# Altium schematic sheet Display.SchDoc
size A; SheetNumber: 4; SheetTotal: 6
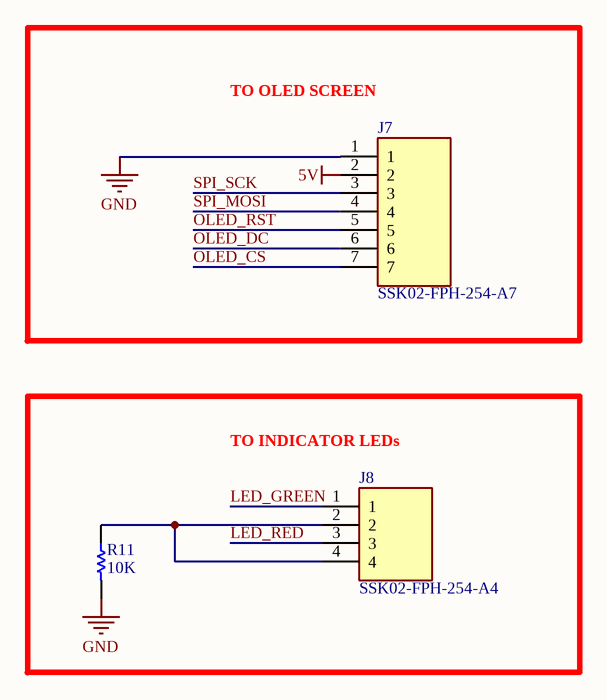
[diagram p0: Display.SchDoc]

## Parts
J7  SSK02-FPH-254-A7  [SAMESKY_SSK02-FPH-254-A7]
J8  SSK02-FPH-254-A4  [SAMESKY_SSK02-FPH-254-A4]
R11  10K  [RESA60-630X240]

## Blocks framed on the sheet
TO OLED SCREEN: J7
TO INDICATOR LEDs: J8 R11

## Nets
5V: J7.2
GND: J7.1 R11.2
LED_GREEN: J8.1
LED_RED: J8.3
OLED_CS: J7.7
OLED_DC: J7.6
OLED_RST: J7.5
SPI_MOSI: J7.4
SPI_SCK: J7.3
NetJ8_2: J8.2 J8.4 R11.1

## Library data of the parts
J7 = SSK02-FPH-254-A7: MF: {'manufacturer': u'Same Sky (Formerly CUI Devices)'}; Package: None; Price: None; Value: *; MP: SSK02-FPH-254-A7; Availability: Unavailable
J8 = SSK02-FPH-254-A4: 4 Position Header Connector 0.100 (2.54mm) Through Hole Gold; MF: Same Sky (Formerly CUI Devices); SnapEDA_Link: https://www.snapeda.com/parts/SSK02-FPH-254-A4/Same+Sky/view-part/?ref=snap; Package: None; Value: *; MP: SSK02-FPH-254-A4; Check_prices: https://www.snapeda.com/parts/SSK02-FPH-254-A4/Same+Sky/view-part/?ref=eda
R11 = CMP-1659-00070-1: Axial Resistor, 1 MOhm, +/- 1%, 250 mW, -55 to 155 degC, 2-Pin THD, RoHS, Bulk; Power Rating: 250 mW; Resistance: 47.5 kohm; Voltage Rating: 250 V; ComponentLink1Description: Manufacturer URL; PackageReference: MFR-25; ComponentLink2Description: Datasheet; ComponentLink2URL: http://www.yageo.com/documents/recent/Yageo%20LR_MFR_2013.pdf; Tolerance: 1%; DatasheetVersion: Apr-13; Package Quantity: 200; Packaging: Bulk; Case\Package: Axial; RoHSCompliant: true; ComponentLink1URL: http://www.yageo.com/; Length: 0.248 inch; Min Operating Temperature: -55 degC; Mount: Through Hole; PackageDescription: 2-Pin Axial Lead, Dia 2.4 mm, Body Length 6.3 mm; Max Operating Temperature: 155 degC